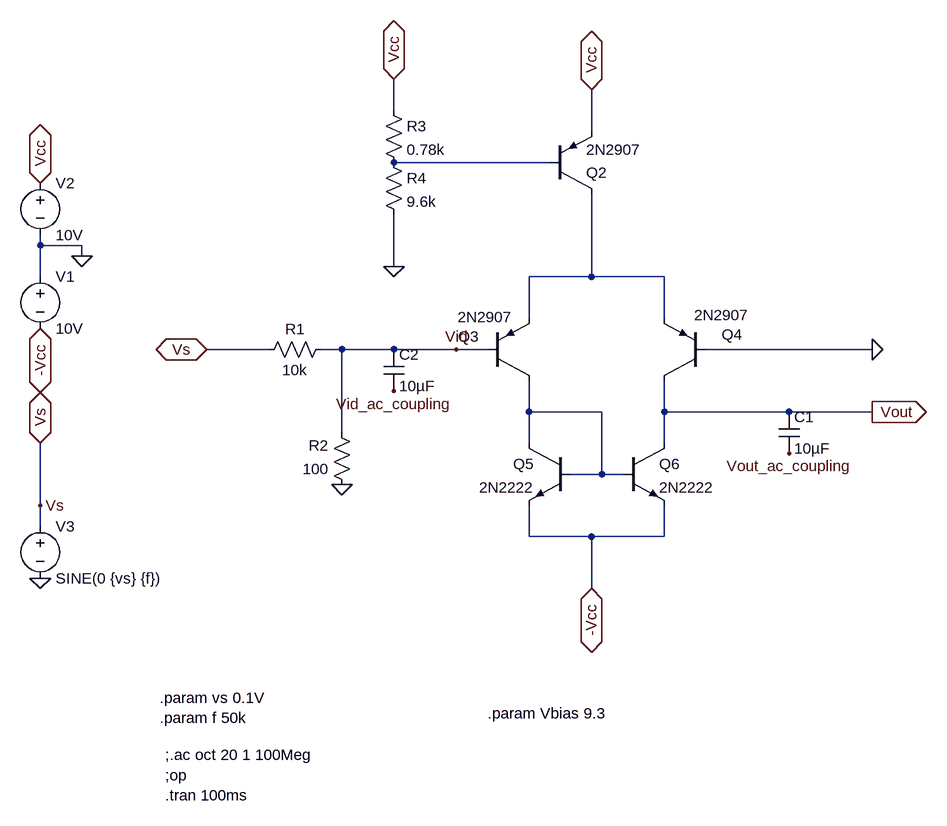
[diagram p0: schematic final_lab_4_pot.asc]
final_lab_4_pot.asc, the LTspice schematic file:
Version 4
SHEET 1 2336 816
WIRE 896 -272 896 -320
WIRE 1200 -240 1200 -304
WIRE 1136 -192 896 -192
WIRE 352 -64 352 -80
WIRE 416 -64 352 -64
WIRE 416 -48 416 -64
WIRE 896 -32 896 -112
WIRE 352 -16 352 -64
WIRE 1200 -16 1200 -144
WIRE 1200 -16 1104 -16
WIRE 1312 -16 1200 -16
WIRE 1104 48 1104 -16
WIRE 1312 48 1312 -16
WIRE 704 96 608 96
WIRE 816 96 784 96
WIRE 896 96 816 96
WIRE 992 96 896 96
WIRE 1040 96 992 96
WIRE 1632 96 1376 96
WIRE 1104 192 1104 144
WIRE 1216 192 1104 192
WIRE 1312 192 1312 144
WIRE 1504 192 1312 192
WIRE 1632 192 1504 192
WIRE 816 224 816 96
WIRE 1104 240 1104 192
WIRE 1312 240 1312 192
WIRE 1216 288 1216 192
WIRE 1216 288 1168 288
WIRE 1248 288 1216 288
WIRE 352 336 352 240
WIRE 352 368 352 336
WIRE 1104 384 1104 336
WIRE 1200 384 1104 384
WIRE 1312 384 1312 336
WIRE 1312 384 1200 384
WIRE 1200 464 1200 384
FLAG 416 -48 0
FLAG 352 64 -Vcc
IOPIN 352 64 BiDir
FLAG 352 -160 Vcc
IOPIN 352 -160 BiDir
FLAG 352 448 0
FLAG 352 336 Vs
FLAG 1632 192 Vout
IOPIN 1632 192 Out
FLAG 352 240 Vs
IOPIN 352 240 BiDir
FLAG 1200 464 -Vcc
IOPIN 1200 464 BiDir
FLAG 896 -32 0
FLAG 1632 96 0
FLAG 1200 -304 Vcc
IOPIN 1200 -304 BiDir
FLAG 608 96 Vs
IOPIN 608 96 BiDir
FLAG 816 304 0
FLAG 992 96 Vid
FLAG 1504 256 Vout_ac_coupling
FLAG 896 160 Vid_ac_coupling
FLAG 896 -320 Vcc
IOPIN 896 -320 BiDir
SYMBOL Voltage 352 -32 R0
SYMATTR InstName V1
SYMATTR Value 10V
SYMBOL Voltage 352 -176 R0
WINDOW 123 0 0 Left 0
WINDOW 39 0 0 Left 0
SYMATTR InstName V2
SYMATTR Value 10V
SYMBOL Voltage 352 352 R0
SYMATTR InstName V3
SYMATTR Value SINE(0 {vs} {f})
SYMATTR Value2 AC {vs}
SYMBOL npn 1168 240 M0
SYMATTR InstName Q5
SYMATTR Value 2N2222
SYMBOL npn 1248 240 R0
SYMATTR InstName Q6
SYMATTR Value 2N2222
SYMBOL pnp 1040 144 M180
WINDOW 0 -45 68 Left 2
WINDOW 3 -46 98 Left 2
SYMATTR InstName Q3
SYMATTR Value 2N2907
SYMBOL pnp 1376 144 R180
WINDOW 0 -57 71 Left 2
WINDOW 3 -67 101 Left 2
SYMATTR InstName Q4
SYMATTR Value 2N2907
SYMBOL pnp 1136 -144 M180
SYMATTR InstName Q2
SYMATTR Value 2N2907
SYMBOL Res 800 80 R90
WINDOW 0 0 56 VBottom 2
WINDOW 3 32 56 VTop 2
SYMATTR InstName R1
SYMATTR Value 10k
SYMBOL Res 832 320 R180
WINDOW 0 36 76 Left 2
WINDOW 3 36 40 Left 2
SYMATTR InstName R2
SYMATTR Value 100
SYMBOL Cap 1488 192 R0
SYMATTR InstName C1
SYMATTR Value 10µF
SYMBOL Cap 880 96 R0
SYMATTR InstName C2
SYMATTR Value 10µF
SYMBOL Res 880 -288 R0
SYMATTR InstName R3
SYMATTR Value 0.78k
SYMBOL Res 880 -208 R0
SYMATTR InstName R4
SYMATTR Value 9.6k
TEXT 536 632 Left 2 !.param vs 0.1V\n.param f 50k
TEXT 544 720 Left 2 !;.ac oct 20 1 100Meg\n;op\n.tran 100ms
TEXT 1040 656 Left 2 !.param Vbias 9.3

The netlist it stands for:
* final_lab_4_pot.asc
V1 0 -Vcc 10V
V2 Vcc 0 10V
V3 Vs 0 SINE(0 {vs} {f}) AC {vs}
Q5 N003 N003 -Vcc 0 2N2222
Q6 Vout N003 -Vcc 0 2N2222
Q3 N003 Vid N002 0 2N2907
Q4 Vout 0 N002 0 2N2907
Q2 N002 N001 Vcc 0 2N2907
R1 Vid Vs 10k
R2 0 Vid 100
C1 Vout Vout_ac_coupling 10µF
C2 Vid Vid_ac_coupling 10µF
R3 Vcc N001 0.78k
R4 N001 0 9.6k
.model NPN NPN
.model PNP PNP
.lib standard.bjt
.param vs 0.1V
.param f 50k
;.ac oct 20 1 100Meg
;op
.tran 100ms
.param Vbias 9.3
.backanno
.end